# Altium schematic sheet uni project 1.SchDoc
size A4; SheetNumber: 1; SheetTotal: 1
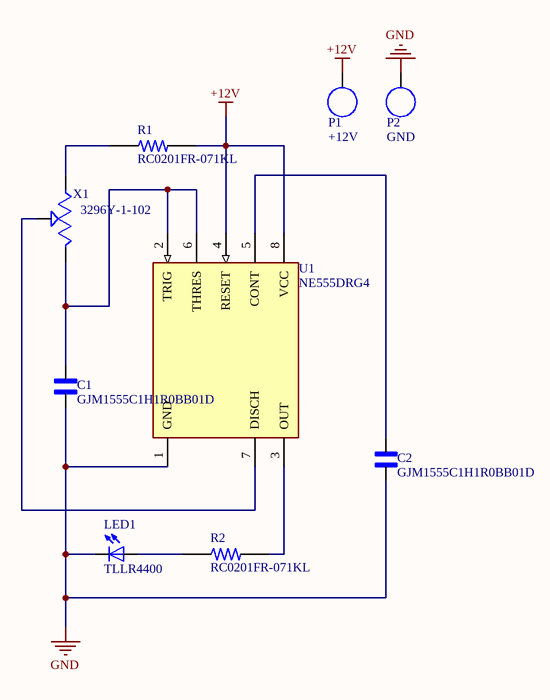
[diagram p0: uni project 1.SchDoc]

## Parts
C1  GJM1555C1H1R0BB01D  [CAPC1005X55N]
C2  GJM1555C1H1R0BB01D  [CAPC1005X55N]
LED1  TLLR4400  [LED3MM IR]
P1  +12V  [Pin1]
P2  GND  [Pin1]
R1  RC0201FR-071KL  [RESC0603X26N]
R2  RC0201FR-071KL  [RESC0603X26N]
U1  NE555DRG4  [SO-8]
X1  3296Y-1-102  [TRIM_3296Y-1-102]

## Nets
+12V: P1.0 R1.2 U1.4(RESET) U1.8(VCC)
GND: C1.1 C2.1 LED1.C P2.0 U1.1(GND)
NetC1_2: C1.2 U1.2(TRIG) U1.6(THRES) X1.1(CCW)
NetC2_2: C2.2 U1.5(CONT)
NetLED1_A: LED1.A R2.1
NetR1_1: R1.1 X1.3(CW)
NetR2_2: R2.2 U1.3(OUT)
NetU1_7: U1.7(DISCH) X1.2(WIPER)

## Library data of the parts
C1 C2 = GJM1555C1H1R0BB01D: 0402 1 pF 50 V Â±0.1 pF Tolerance C0G SMT Multilayer Ceramic Capacitor; MF: Murata; SnapEDA_Link: https://www.snapeda.com/parts/GJM1555C1H1R0BB01D/Murata/view-part/?ref=snap; Package: 1005 Taiyo Yuden; Value: *; MP: GJM1555C1H1R0BB01D; Check_prices: https://www.snapeda.com/parts/GJM1555C1H1R0BB01D/Murata/view-part/?ref=eda
LED1 = TLLR4400: Red 619nm LED Indication - Discrete 1.9V Radial; MF: Vishay; SnapEDA_Link: https://www.snapeda.com/parts/TLLR4400/Vishay+Semiconductor+Opto+Division/view-part/?ref=snap; Package: None; Value: *; MP: TLLR4400; Check_prices: https://www.snapeda.com/parts/TLLR4400/Vishay+Semiconductor+Opto+Division/view-part/?ref=eda
P1 P2 = Pin1
R1 R2 = RC0201FR-071KL: 1 kOhms Â±1% 0.05W, 1/20W Chip Resistor 0201 (0603 Metric) Moisture Resistant Thick Film; MF: Yageo; SnapEDA_Link: https://www.snapeda.com/parts/RC0201FR-071KL/Yageo/view-part/?ref=snap; Package: 0201 Yageo; Value: *; MP: RC0201FR-071KL; Check_prices: https://www.snapeda.com/parts/RC0201FR-071KL/Yageo/view-part/?ref=eda
U1 = NE555: IC OSC SGL TIMER 100KHZ 8-SOIC; Number of Timers/Counters: 1; Min Supply Voltage: 4.5V; Quiescent Current: 15mA; Nominal Supply Current: 2mA; Max Supply Voltage: 16V; Low Level Output Current: 200mA; Operating Supply Current: 10mA; High Level Output Current: -200mA; Height: 1.58mm; Max Operating Temperature: 70°C; Case/Package: SOIC; Package Quantity: 2500; RoHS Compliant: Yes; Min Operating Temperature: 0°C; Frequency: 100kHz; Width: 3.91mm; Mount: Surface Mount; Number of Pins: 8; Packaging: Tape and Reel; Supply Current: 2mA; Length: 4.9mm; Series: -; Weight: 0.002561oz; Radiation Hardening: No; Lead Free: Lead Free
X1 = 3296Y-1-102: MP: 3296Y-1-102; Package: None; Price: None; Availability: Unavailable; Value: *